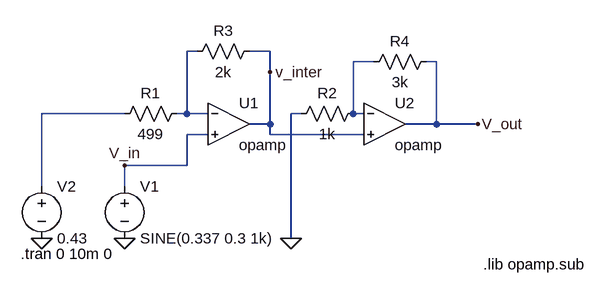
[diagram p0: schematic 20x_gain_test.asc]
20x_gain_test.asc, the LTspice schematic file:
Version 4.1
SHEET 1 880 680
WIRE 112 -64 96 -64
WIRE 224 -64 192 -64
WIRE 384 -48 352 -48
WIRE 480 -48 464 -48
WIRE 224 -32 224 -64
WIRE 0 32 -128 32
WIRE 96 32 96 -64
WIRE 96 32 80 32
WIRE 128 32 96 32
WIRE 272 32 256 32
WIRE 352 32 352 -48
WIRE 368 32 352 32
WIRE 224 48 224 -32
WIRE 224 48 192 48
WIRE 480 48 480 -48
WIRE 480 48 432 48
WIRE 544 48 480 48
WIRE 128 64 96 64
WIRE 224 64 224 48
WIRE 368 64 224 64
WIRE 96 112 96 64
WIRE 96 112 0 112
WIRE -128 144 -128 32
WIRE 0 144 0 112
WIRE 256 224 256 32
FLAG 256 224 0
FLAG 0 224 0
FLAG -128 224 0
FLAG 544 48 V_out
FLAG 0 112 V_in
FLAG 224 -32 v_inter
SYMBOL voltage 0 128 R0
WINDOW 123 0 0 Left 0
WINDOW 39 0 0 Left 0
SYMATTR InstName V1
SYMATTR Value SINE(0.337 0.3 1k)
SYMBOL OpAmps\\opamp 160 -16 R0
SYMATTR InstName U1
SYMBOL res 96 16 R90
WINDOW 0 0 56 VBottom 2
WINDOW 3 32 56 VTop 2
SYMATTR InstName R1
SYMATTR Value 499
SYMBOL voltage -128 128 R0
WINDOW 123 0 0 Left 0
WINDOW 39 0 0 Left 0
SYMATTR InstName V2
SYMATTR Value 0.43
SYMBOL OpAmps\\opamp 400 -16 R0
SYMATTR InstName U2
SYMBOL res 368 16 R90
WINDOW 0 0 56 VBottom 2
WINDOW 3 32 56 VTop 2
SYMATTR InstName R2
SYMATTR Value 1k
SYMBOL res 208 -80 R90
WINDOW 0 0 56 VBottom 2
WINDOW 3 32 56 VTop 2
SYMATTR InstName R3
SYMATTR Value 2k
SYMBOL res 480 -64 R90
WINDOW 0 0 56 VBottom 2
WINDOW 3 32 56 VTop 2
SYMATTR InstName R4
SYMATTR Value 3k
TEXT -160 248 Left 2 !.tran 0 10m 0
TEXT 552 264 Left 2 !.lib opamp.sub

The netlist it stands for:
* 20x_gain_test.asc
V1 V_in 0 SINE(0.337 0.3 1k)
X§U1 N001 V_in v_inter opamp Aol=100K GBW=10Meg  ; pins invin noninvin out
R1 N001 N003 499
V2 N003 0 0.43
X§U2 N002 v_inter V_out opamp Aol=100K GBW=10Meg  ; pins invin noninvin out
R2 N002 0 1k
R3 v_inter N001 2k
R4 V_out N002 3k
.tran 0 10m 0
.lib opamp.sub
.backanno
.end